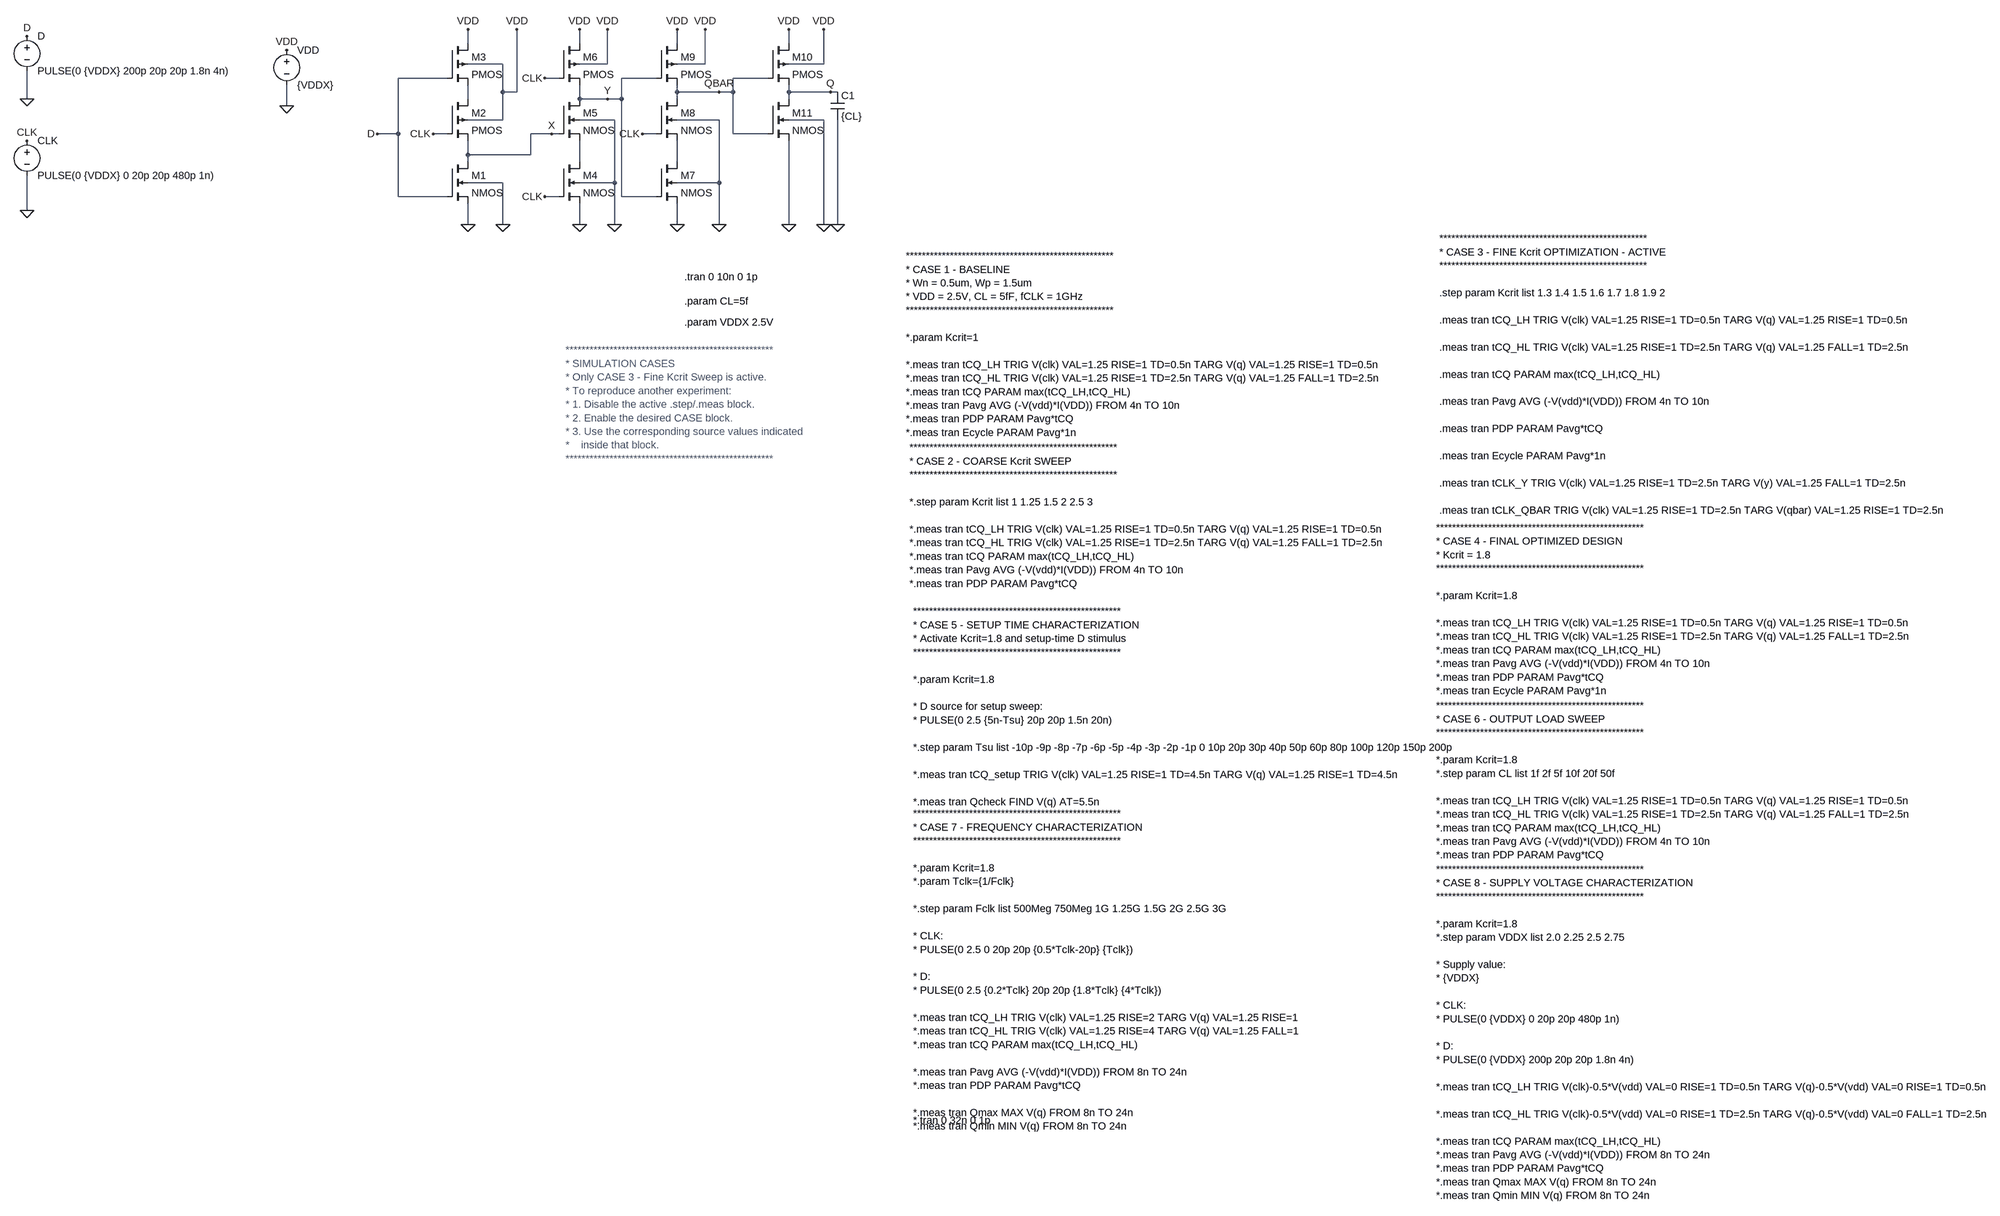
[diagram p0: schematic TSPC.asc]
TSPC.asc, the LTspice schematic file:
Version 4
SHEET 1 3776 2440
WIRE 160 -144 160 -176
WIRE 416 -144 416 -176
WIRE 640 -144 640 -176
WIRE 896 -144 896 -176
WIRE 240 -96 160 -96
WIRE 480 -96 480 -176
WIRE 480 -96 416 -96
WIRE 704 -96 704 -176
WIRE 704 -96 640 -96
WIRE 976 -96 976 -176
WIRE 976 -96 896 -96
WIRE 112 -64 0 -64
WIRE 368 -64 336 -64
WIRE 592 -64 512 -64
WIRE 848 -64 768 -64
WIRE 240 -32 240 -96
WIRE 272 -32 272 -176
WIRE 272 -32 240 -32
WIRE 640 -32 640 -48
WIRE 736 -32 640 -32
WIRE 768 -32 768 -64
WIRE 768 -32 736 -32
WIRE 896 -32 896 -48
WIRE 992 -32 896 -32
WIRE 1008 -32 992 -32
WIRE -992 -16 -992 -80
WIRE 160 -16 160 -48
WIRE 416 -16 416 -48
WIRE 480 -16 416 -16
WIRE 512 -16 512 -64
WIRE 512 -16 480 -16
WIRE 640 -16 640 -32
WIRE 896 -16 896 -32
WIRE -256 0 -256 -48
WIRE 240 32 240 -32
WIRE 240 32 160 32
WIRE 496 32 416 32
WIRE 736 32 640 32
WIRE 976 32 896 32
WIRE 0 64 0 -64
WIRE 0 64 -48 64
WIRE 112 64 80 64
WIRE 352 64 304 64
WIRE 368 64 352 64
WIRE 592 64 560 64
WIRE 768 64 768 -32
WIRE 848 64 768 64
WIRE 160 112 160 80
WIRE 304 112 304 64
WIRE 304 112 160 112
WIRE 160 128 160 112
WIRE 416 128 416 80
WIRE 640 128 640 80
WIRE 240 176 160 176
WIRE 496 176 496 32
WIRE 496 176 416 176
WIRE 736 176 736 32
WIRE 736 176 640 176
WIRE 0 208 0 64
WIRE 112 208 0 208
WIRE 368 208 336 208
WIRE 512 208 512 -16
WIRE 592 208 512 208
WIRE -992 240 -992 160
WIRE 160 272 160 224
WIRE 240 272 240 176
WIRE 416 272 416 224
WIRE 496 272 496 176
WIRE 640 272 640 224
WIRE 736 272 736 176
WIRE 896 272 896 80
WIRE 976 272 976 32
WIRE 1008 272 1008 32
FLAG -256 0 0
FLAG -992 -16 0
FLAG -256 -128 VDD
FLAG -992 -160 D
FLAG 160 272 0
FLAG -48 64 D
FLAG 160 -176 VDD
FLAG 80 64 CLK
FLAG 416 -176 VDD
FLAG 336 208 CLK
FLAG 240 272 0
FLAG 416 272 0
FLAG 496 272 0
FLAG 336 -64 CLK
FLAG 272 -176 VDD
FLAG 640 -176 VDD
FLAG 640 272 0
FLAG 560 64 CLK
FLAG 736 272 0
FLAG 480 -176 VDD
FLAG 896 -176 VDD
FLAG -992 240 0
FLAG -992 80 CLK
FLAG 352 64 X
FLAG 480 -16 Y
FLAG 704 -176 VDD
FLAG 896 272 0
FLAG 1008 272 0
FLAG 992 -32 Q
FLAG 736 -32 QBAR
FLAG 976 -176 VDD
FLAG 976 272 0
SYMBOL nmos4 112 128 R0
SYMATTR InstName M1
SYMATTR Value2 l=0.25u w=0.5u
SYMBOL pmos4 112 -16 R0
SYMATTR InstName M2
SYMATTR Value2 l=0.25u w=1.5u
SYMBOL voltage -256 -144 R0
WINDOW 123 0 0 Left 0
WINDOW 39 0 0 Left 0
SYMATTR InstName VDD
SYMATTR Value {VDDX}
SYMBOL voltage -992 -176 R0
WINDOW 123 0 0 Left 0
WINDOW 39 0 0 Left 0
SYMATTR InstName D
SYMATTR Value PULSE(0 {VDDX} 200p 20p 20p 1.8n 4n)
SYMBOL pmos4 112 -144 R0
SYMATTR InstName M3
SYMATTR Value2 l=0.25u w=1.5u
SYMBOL pmos4 368 -144 R0
SYMATTR InstName M6
SYMATTR Value2 l=0.25u w=1.5u
SYMBOL nmos4 368 -16 R0
SYMATTR InstName M5
SYMATTR Value2 l=0.25u w={0.5u*Kcrit}
SYMBOL nmos4 368 128 R0
SYMATTR InstName M4
SYMATTR Value2 l=0.25u w={0.5u*Kcrit}
SYMBOL pmos4 592 -144 R0
SYMATTR InstName M9
SYMATTR Value2 l=0.25u w={1.5u*Kcrit}
SYMBOL nmos4 592 -16 R0
SYMATTR InstName M8
SYMATTR Value2 l=0.25u w=0.5u
SYMBOL nmos4 592 128 R0
SYMATTR InstName M7
SYMATTR Value2 l=0.25u w=0.5u
SYMBOL voltage -992 64 R0
WINDOW 123 0 0 Left 0
WINDOW 39 0 0 Left 0
SYMATTR InstName CLK
SYMATTR Value PULSE(0 {VDDX} 0 20p 20p 480p 1n)
SYMBOL pmos4 848 -144 R0
SYMATTR InstName M10
SYMATTR Value2 l=0.25u w=1.5u
SYMBOL nmos4 848 -16 R0
SYMATTR InstName M11
SYMATTR Value2 l=0.25u w={0.5u*Kcrit}
SYMBOL cap 992 -32 R0
SYMATTR InstName C1
SYMATTR Value {CL}
TEXT 1200 344 Left 2 !****************************************************\n* CASE 1 - BASELINE\n* Wn = 0.5um, Wp = 1.5um\n* VDD = 2.5V, CL = 5fF, fCLK = 1GHz\n****************************************************\n \n*.param Kcrit=1\n \n*.meas tran tCQ_LH TRIG V(clk) VAL=1.25 RISE=1 TD=0.5n TARG V(q) VAL=1.25 RISE=1 TD=0.5n\n*.meas tran tCQ_HL TRIG V(clk) VAL=1.25 RISE=1 TD=2.5n TARG V(q) VAL=1.25 FALL=1 TD=2.5n\n*.meas tran tCQ PARAM max(tCQ_LH,tCQ_HL)\n*.meas tran Pavg AVG (-V(vdd)*I(VDD)) FROM 4n TO 10n\n*.meas tran PDP PARAM Pavg*tCQ\n*.meas tran Ecycle PARAM Pavg*1n
TEXT 2424 304 Left 2 !****************************************************\n* CASE 3 - FINE Kcrit OPTIMIZATION - ACTIVE\n****************************************************\n \n.step param Kcrit list 1.3 1.4 1.5 1.6 1.7 1.8 1.9 2\n \n.meas tran tCQ_LH TRIG V(clk) VAL=1.25 RISE=1 TD=0.5n TARG V(q) VAL=1.25 RISE=1 TD=0.5n\n \n.meas tran tCQ_HL TRIG V(clk) VAL=1.25 RISE=1 TD=2.5n TARG V(q) VAL=1.25 FALL=1 TD=2.5n\n \n.meas tran tCQ PARAM max(tCQ_LH,tCQ_HL)\n \n.meas tran Pavg AVG (-V(vdd)*I(VDD)) FROM 4n TO 10n\n \n.meas tran PDP PARAM Pavg*tCQ\n \n.meas tran Ecycle PARAM Pavg*1n\n \n.meas tran tCLK_Y TRIG V(clk) VAL=1.25 RISE=1 TD=2.5n TARG V(y) VAL=1.25 FALL=1 TD=2.5n\n \n.meas tran tCLK_QBAR TRIG V(clk) VAL=1.25 RISE=1 TD=2.5n TARG V(qbar) VAL=1.25 RISE=1 TD=2.5n
TEXT 1208 784 Left 2 !****************************************************\n* CASE 2 - COARSE Kcrit SWEEP\n****************************************************\n \n*.step param Kcrit list 1 1.25 1.5 2 2.5 3\n \n*.meas tran tCQ_LH TRIG V(clk) VAL=1.25 RISE=1 TD=0.5n TARG V(q) VAL=1.25 RISE=1 TD=0.5n\n*.meas tran tCQ_HL TRIG V(clk) VAL=1.25 RISE=1 TD=2.5n TARG V(q) VAL=1.25 FALL=1 TD=2.5n\n*.meas tran tCQ PARAM max(tCQ_LH,tCQ_HL)\n*.meas tran Pavg AVG (-V(vdd)*I(VDD)) FROM 4n TO 10n\n*.meas tran PDP PARAM Pavg*tCQ
TEXT 656 392 Left 2 !.tran 0 10n 0 1p
TEXT 2416 968 Left 2 !****************************************************\n* CASE 4 - FINAL OPTIMIZED DESIGN\n* Kcrit = 1.8\n****************************************************\n \n*.param Kcrit=1.8\n \n*.meas tran tCQ_LH TRIG V(clk) VAL=1.25 RISE=1 TD=0.5n TARG V(q) VAL=1.25 RISE=1 TD=0.5n\n*.meas tran tCQ_HL TRIG V(clk) VAL=1.25 RISE=1 TD=2.5n TARG V(q) VAL=1.25 FALL=1 TD=2.5n\n*.meas tran tCQ PARAM max(tCQ_LH,tCQ_HL)\n*.meas tran Pavg AVG (-V(vdd)*I(VDD)) FROM 4n TO 10n\n*.meas tran PDP PARAM Pavg*tCQ\n*.meas tran Ecycle PARAM Pavg*1n
TEXT 1216 1160 Left 2 !****************************************************\n* CASE 5 - SETUP TIME CHARACTERIZATION\n* Activate Kcrit=1.8 and setup-time D stimulus\n****************************************************\n \n*.param Kcrit=1.8\n \n* D source for setup sweep:\n* PULSE(0 2.5 {5n-Tsu} 20p 20p 1.5n 20n)\n \n*.step param Tsu list -10p -9p -8p -7p -6p -5p -4p -3p -2p -1p 0 10p 20p 30p 40p 50p 60p 80p 100p 120p 150p 200p\n \n*.meas tran tCQ_setup TRIG V(clk) VAL=1.25 RISE=1 TD=4.5n TARG V(q) VAL=1.25 RISE=1 TD=4.5n\n \n*.meas tran Qcheck FIND V(q) AT=5.5n
TEXT 2416 1376 Left 2 !****************************************************\n* CASE 6 - OUTPUT LOAD SWEEP\n****************************************************\n \n*.param Kcrit=1.8\n*.step param CL list 1f 2f 5f 10f 20f 50f\n \n*.meas tran tCQ_LH TRIG V(clk) VAL=1.25 RISE=1 TD=0.5n TARG V(q) VAL=1.25 RISE=1 TD=0.5n\n*.meas tran tCQ_HL TRIG V(clk) VAL=1.25 RISE=1 TD=2.5n TARG V(q) VAL=1.25 FALL=1 TD=2.5n\n*.meas tran tCQ PARAM max(tCQ_LH,tCQ_HL)\n*.meas tran Pavg AVG (-V(vdd)*I(VDD)) FROM 4n TO 10n\n*.meas tran PDP PARAM Pavg*tCQ
TEXT 656 448 Left 2 !.param CL=5f
TEXT 1216 1624 Left 2 !****************************************************\n* CASE 7 - FREQUENCY CHARACTERIZATION\n****************************************************\n \n*.param Kcrit=1.8\n*.param Tclk={1/Fclk}\n \n*.step param Fclk list 500Meg 750Meg 1G 1.25G 1.5G 2G 2.5G 3G\n \n* CLK:\n* PULSE(0 2.5 0 20p 20p {0.5*Tclk-20p} {Tclk})\n \n* D:\n* PULSE(0 2.5 {0.2*Tclk} 20p 20p {1.8*Tclk} {4*Tclk})\n \n*.meas tran tCQ_LH TRIG V(clk) VAL=1.25 RISE=2 TARG V(q) VAL=1.25 RISE=1\n*.meas tran tCQ_HL TRIG V(clk) VAL=1.25 RISE=4 TARG V(q) VAL=1.25 FALL=1\n*.meas tran tCQ PARAM max(tCQ_LH,tCQ_HL)\n \n*.meas tran Pavg AVG (-V(vdd)*I(VDD)) FROM 8n TO 24n\n*.meas tran PDP PARAM Pavg*tCQ\n \n*.meas tran Qmax MAX V(q) FROM 8n TO 24n\n*.meas tran Qmin MIN V(q) FROM 8n TO 24n
TEXT 1216 2328 Left 2 !*.tran 0 32n 0 1p
TEXT 2416 1752 Left 2 !****************************************************\n* CASE 8 - SUPPLY VOLTAGE CHARACTERIZATION\n****************************************************\n \n*.param Kcrit=1.8\n*.step param VDDX list 2.0 2.25 2.5 2.75\n \n* Supply value:\n* {VDDX}\n \n* CLK:\n* PULSE(0 {VDDX} 0 20p 20p 480p 1n)\n \n* D:\n* PULSE(0 {VDDX} 200p 20p 20p 1.8n 4n)\n \n*.meas tran tCQ_LH TRIG V(clk)-0.5*V(vdd) VAL=0 RISE=1 TD=0.5n TARG V(q)-0.5*V(vdd) VAL=0 RISE=1 TD=0.5n\n \n*.meas tran tCQ_HL TRIG V(clk)-0.5*V(vdd) VAL=0 RISE=1 TD=2.5n TARG V(q)-0.5*V(vdd) VAL=0 FALL=1 TD=2.5n\n \n*.meas tran tCQ PARAM max(tCQ_LH,tCQ_HL)\n*.meas tran Pavg AVG (-V(vdd)*I(VDD)) FROM 8n TO 24n\n*.meas tran PDP PARAM Pavg*tCQ\n*.meas tran Qmax MAX V(q) FROM 8n TO 24n\n*.meas tran Qmin MIN V(q) FROM 8n TO 24n
TEXT 384 560 Left 2 ;****************************************************\n* SIMULATION CASES\n* Only CASE 3 - Fine Kcrit Sweep is active.\n* To reproduce another experiment:\n* 1. Disable the active .step/.meas block.\n* 2. Enable the desired CASE block.\n* 3. Use the corresponding source values indicated\n*    inside that block.\n****************************************************
TEXT 656 496 Left 2 !.param VDDX 2.5V

The netlist it stands for:
* TSPC.asc
M1 X D 0 0 NMOS l=0.25u w=0.5u
M2 N001 CLK X VDD PMOS l=0.25u w=1.5u
VDD VDD 0 {VDDX}
V§D D 0 PULSE(0 {VDDX} 200p 20p 20p 1.8n 4n)
M3 VDD D N001 VDD PMOS l=0.25u w=1.5u
M6 VDD CLK Y VDD PMOS l=0.25u w=1.5u
M5 Y X N002 0 NMOS l=0.25u w={0.5u*Kcrit}
M4 N002 CLK 0 0 NMOS l=0.25u w={0.5u*Kcrit}
M9 VDD Y QBAR VDD PMOS l=0.25u w={1.5u*Kcrit}
M8 QBAR CLK N003 0 NMOS l=0.25u w=0.5u
M7 N003 Y 0 0 NMOS l=0.25u w=0.5u
V§CLK CLK 0 PULSE(0 {VDDX} 0 20p 20p 480p 1n)
M10 VDD QBAR Q VDD PMOS l=0.25u w=1.5u
M11 Q QBAR 0 0 NMOS l=0.25u w={0.5u*Kcrit}
C1 Q 0 {CL}
.model NMOS NMOS
.model PMOS PMOS
.lib standard.mos
****************************************************
* CASE 1 - BASELINE
* Wn = 0.5um, Wp = 1.5um
* VDD = 2.5V, CL = 5fF, fCLK = 1GHz
****************************************************
*.param Kcrit=1
*.meas tran tCQ_LH TRIG V(clk) VAL=1.25 RISE=1 TD=0.5n TARG V(q) VAL=1.25 RISE=1 TD=0.5n
*.meas tran tCQ_HL TRIG V(clk) VAL=1.25 RISE=1 TD=2.5n TARG V(q) VAL=1.25 FALL=1 TD=2.5n
*.meas tran tCQ PARAM max(tCQ_LH,tCQ_HL)
*.meas tran Pavg AVG (-V(vdd)*I(VDD)) FROM 4n TO 10n
*.meas tran PDP PARAM Pavg*tCQ
*.meas tran Ecycle PARAM Pavg*1n
****************************************************
* CASE 3 - FINE Kcrit OPTIMIZATION - ACTIVE
****************************************************
.step param Kcrit list 1.3 1.4 1.5 1.6 1.7 1.8 1.9 2
.meas tran tCQ_LH TRIG V(clk) VAL=1.25 RISE=1 TD=0.5n TARG V(q) VAL=1.25 RISE=1 TD=0.5n
.meas tran tCQ_HL TRIG V(clk) VAL=1.25 RISE=1 TD=2.5n TARG V(q) VAL=1.25 FALL=1 TD=2.5n
.meas tran tCQ PARAM max(tCQ_LH,tCQ_HL)
.meas tran Pavg AVG (-V(vdd)*I(VDD)) FROM 4n TO 10n
.meas tran PDP PARAM Pavg*tCQ
.meas tran Ecycle PARAM Pavg*1n
.meas tran tCLK_Y TRIG V(clk) VAL=1.25 RISE=1 TD=2.5n TARG V(y) VAL=1.25 FALL=1 TD=2.5n
.meas tran tCLK_QBAR TRIG V(clk) VAL=1.25 RISE=1 TD=2.5n TARG V(qbar) VAL=1.25 RISE=1 TD=2.5n
****************************************************
* CASE 2 - COARSE Kcrit SWEEP
****************************************************
*.step param Kcrit list 1 1.25 1.5 2 2.5 3
*.meas tran tCQ_LH TRIG V(clk) VAL=1.25 RISE=1 TD=0.5n TARG V(q) VAL=1.25 RISE=1 TD=0.5n
*.meas tran tCQ_HL TRIG V(clk) VAL=1.25 RISE=1 TD=2.5n TARG V(q) VAL=1.25 FALL=1 TD=2.5n
*.meas tran tCQ PARAM max(tCQ_LH,tCQ_HL)
*.meas tran Pavg AVG (-V(vdd)*I(VDD)) FROM 4n TO 10n
*.meas tran PDP PARAM Pavg*tCQ
.tran 0 10n 0 1p
****************************************************
* CASE 4 - FINAL OPTIMIZED DESIGN
* Kcrit = 1.8
****************************************************
*.param Kcrit=1.8
*.meas tran tCQ_LH TRIG V(clk) VAL=1.25 RISE=1 TD=0.5n TARG V(q) VAL=1.25 RISE=1 TD=0.5n
*.meas tran tCQ_HL TRIG V(clk) VAL=1.25 RISE=1 TD=2.5n TARG V(q) VAL=1.25 FALL=1 TD=2.5n
*.meas tran tCQ PARAM max(tCQ_LH,tCQ_HL)
*.meas tran Pavg AVG (-V(vdd)*I(VDD)) FROM 4n TO 10n
*.meas tran PDP PARAM Pavg*tCQ
*.meas tran Ecycle PARAM Pavg*1n
****************************************************
* CASE 5 - SETUP TIME CHARACTERIZATION
* Activate Kcrit=1.8 and setup-time D stimulus
****************************************************
*.param Kcrit=1.8
* D source for setup sweep:
* PULSE(0 2.5 {5n-Tsu} 20p 20p 1.5n 20n)
*.step param Tsu list -10p -9p -8p -7p -6p -5p -4p -3p -2p -1p 0 10p 20p 30p 40p 50p 60p 80p 100p 120p 150p 200p
*.meas tran tCQ_setup TRIG V(clk) VAL=1.25 RISE=1 TD=4.5n TARG V(q) VAL=1.25 RISE=1 TD=4.5n
*.meas tran Qcheck FIND V(q) AT=5.5n
****************************************************
* CASE 6 - OUTPUT LOAD SWEEP
****************************************************
*.param Kcrit=1.8
*.step param CL list 1f 2f 5f 10f 20f 50f
*.meas tran tCQ_LH TRIG V(clk) VAL=1.25 RISE=1 TD=0.5n TARG V(q) VAL=1.25 RISE=1 TD=0.5n
*.meas tran tCQ_HL TRIG V(clk) VAL=1.25 RISE=1 TD=2.5n TARG V(q) VAL=1.25 FALL=1 TD=2.5n
*.meas tran tCQ PARAM max(tCQ_LH,tCQ_HL)
*.meas tran Pavg AVG (-V(vdd)*I(VDD)) FROM 4n TO 10n
*.meas tran PDP PARAM Pavg*tCQ
.param CL=5f
****************************************************
* CASE 7 - FREQUENCY CHARACTERIZATION
****************************************************
*.param Kcrit=1.8
*.param Tclk={1/Fclk}
*.step param Fclk list 500Meg 750Meg 1G 1.25G 1.5G 2G 2.5G 3G
* CLK:
* PULSE(0 2.5 0 20p 20p {0.5*Tclk-20p} {Tclk})
* D:
* PULSE(0 2.5 {0.2*Tclk} 20p 20p {1.8*Tclk} {4*Tclk})
*.meas tran tCQ_LH TRIG V(clk) VAL=1.25 RISE=2 TARG V(q) VAL=1.25 RISE=1
*.meas tran tCQ_HL TRIG V(clk) VAL=1.25 RISE=4 TARG V(q) VAL=1.25 FALL=1
*.meas tran tCQ PARAM max(tCQ_LH,tCQ_HL)
*.meas tran Pavg AVG (-V(vdd)*I(VDD)) FROM 8n TO 24n
*.meas tran PDP PARAM Pavg*tCQ
*.meas tran Qmax MAX V(q) FROM 8n TO 24n
*.meas tran Qmin MIN V(q) FROM 8n TO 24n
*.tran 0 32n 0 1p
****************************************************
* CASE 8 - SUPPLY VOLTAGE CHARACTERIZATION
****************************************************
*.param Kcrit=1.8
*.step param VDDX list 2.0 2.25 2.5 2.75
* Supply value:
* {VDDX}
* CLK:
* PULSE(0 {VDDX} 0 20p 20p 480p 1n)
* D:
* PULSE(0 {VDDX} 200p 20p 20p 1.8n 4n)
*.meas tran tCQ_LH TRIG V(clk)-0.5*V(vdd) VAL=0 RISE=1 TD=0.5n TARG V(q)-0.5*V(vdd) VAL=0 RISE=1 TD=0.5n
*.meas tran tCQ_HL TRIG V(clk)-0.5*V(vdd) VAL=0 RISE=1 TD=2.5n TARG V(q)-0.5*V(vdd) VAL=0 FALL=1 TD=2.5n
*.meas tran tCQ PARAM max(tCQ_LH,tCQ_HL)
*.meas tran Pavg AVG (-V(vdd)*I(VDD)) FROM 8n TO 24n
*.meas tran PDP PARAM Pavg*tCQ
*.meas tran Qmax MAX V(q) FROM 8n TO 24n
*.meas tran Qmin MIN V(q) FROM 8n TO 24n
* ****************************************************
* * SIMULATION CASES
* * Only CASE 3 - Fine Kcrit Sweep is active.
* * To reproduce another experiment:
* * 1. Disable the active .step/.meas block.
* * 2. Enable the desired CASE block.
* * 3. Use the corresponding source values indicated
* *    inside that block.
* ****************************************************
.param VDDX 2.5V
.backanno
.end